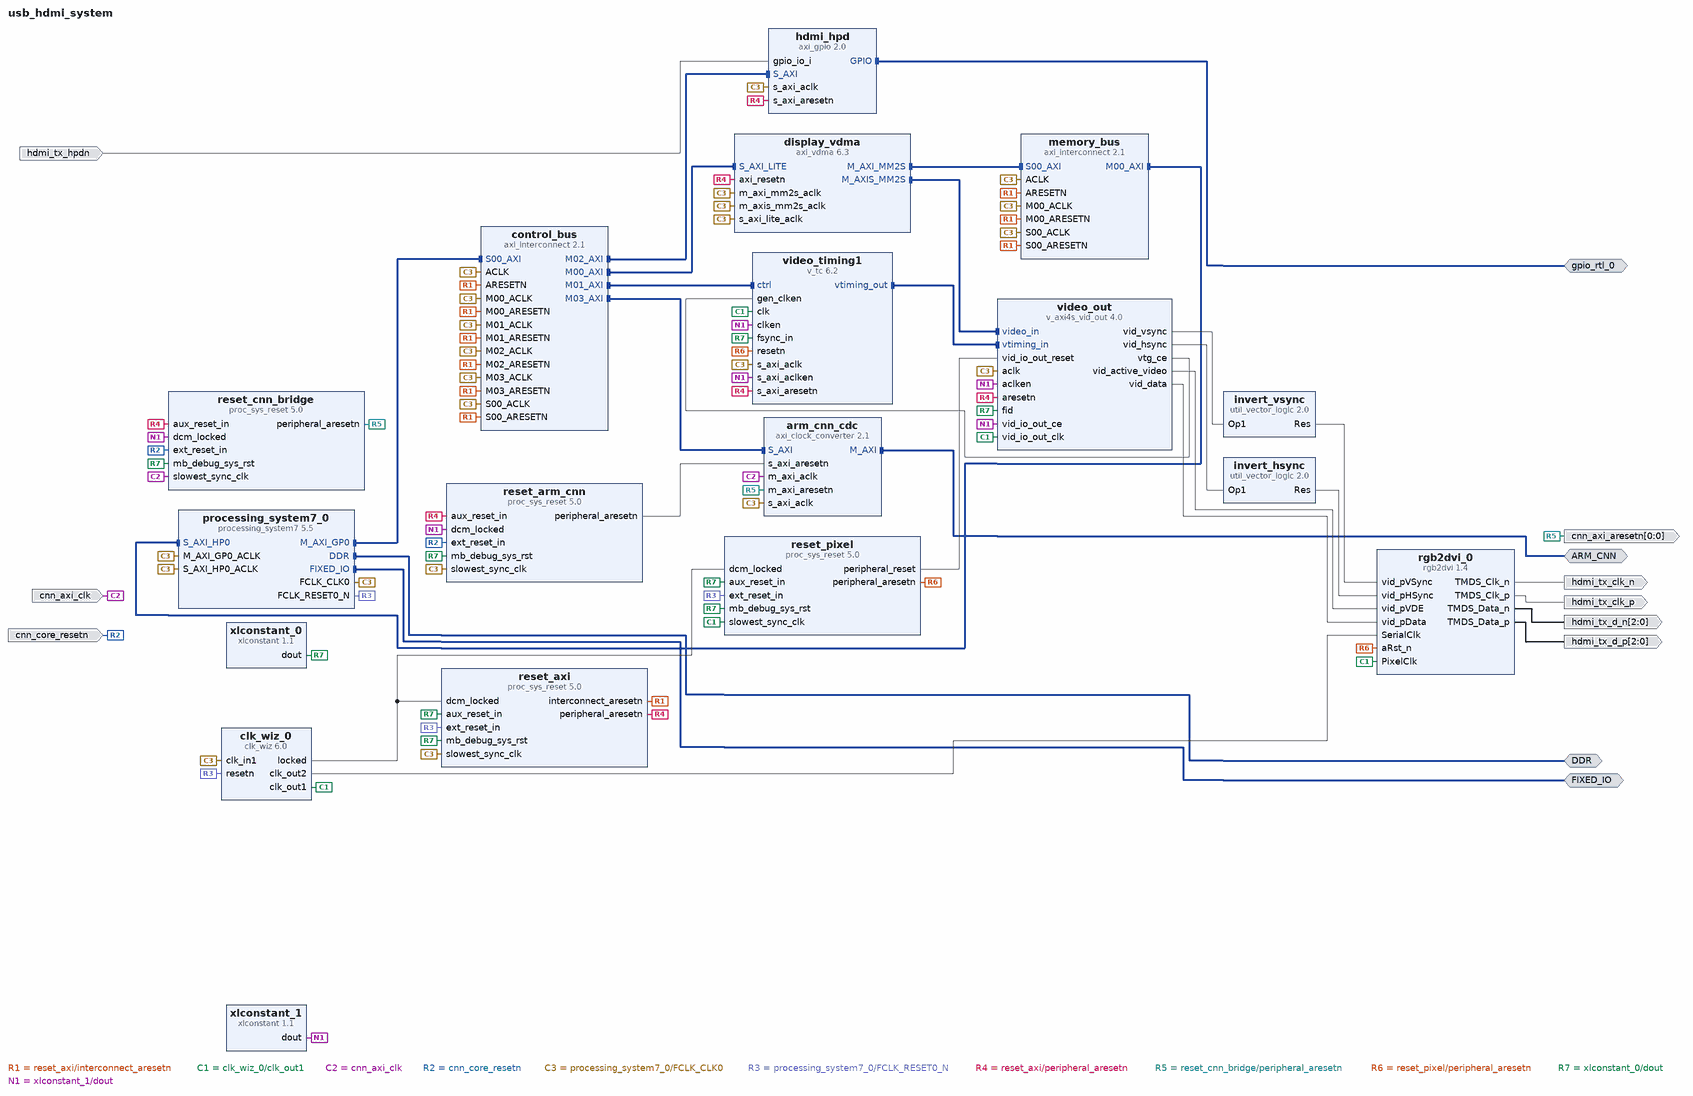
[diagram p0: block diagram of the top level]
# Vivado block design usb_hdmi_system, xc7z020clg400-1, Vivado 2025.2
create_bd_design usb_hdmi_system

create_bd_intf_port -mode Master -vlnv xilinx.com:interface:ddrx_rtl:1.0 DDR
create_bd_intf_port -mode Master -vlnv xilinx.com:display_processing_system7:fixedio_rtl:1.0 FIXED_IO
create_bd_intf_port -mode Master -vlnv xilinx.com:interface:gpio_rtl:1.0 gpio_rtl_0
create_bd_intf_port -mode Master -vlnv xilinx.com:interface:aximm_rtl:1.0 ARM_CNN
set_property -dict [list \
  CONFIG.ADDR_WIDTH 32 \
  CONFIG.DATA_WIDTH 32 \
  CONFIG.FREQ_HZ 125000000 \
  CONFIG.HAS_BRESP 1 \
  CONFIG.HAS_RRESP 1 \
  CONFIG.HAS_WSTRB 1 \
  CONFIG.PROTOCOL AXI4LITE \
] [get_bd_intf_ports ARM_CNN]
create_bd_port -dir O hdmi_tx_clk_p
create_bd_port -dir O hdmi_tx_clk_n
create_bd_port -dir O -from 2 -to 0 hdmi_tx_d_p
create_bd_port -dir O -from 2 -to 0 hdmi_tx_d_n
create_bd_port -dir I hdmi_tx_hpdn
create_bd_port -dir I -type clk cnn_axi_clk
set_property -dict [list \
  CONFIG.ASSOCIATED_BUSIF ARM_CNN \
  CONFIG.ASSOCIATED_RESET cnn_axi_aresetn \
  CONFIG.FREQ_HZ 125000000 \
] [get_bd_ports cnn_axi_clk]
create_bd_port -dir I -type rst cnn_core_resetn
set_property -dict {CONFIG.POLARITY ACTIVE_LOW} [get_bd_ports cnn_core_resetn]
create_bd_port -dir O -from 0 -to 0 -type rst cnn_axi_aresetn
set_property -dict {CONFIG.POLARITY ACTIVE_LOW} [get_bd_ports cnn_axi_aresetn]

create_bd_cell -type ip -vlnv xilinx.com:ip:processing_system7:5.5 processing_system7_0
set_property -dict [list \
  CONFIG.PCW_APU_PERIPHERAL_FREQMHZ 650 \
  CONFIG.PCW_CRYSTAL_PERIPHERAL_FREQMHZ 50 \
  CONFIG.PCW_ENET0_ENET0_IO {MIO 16 .. 27} \
  CONFIG.PCW_ENET0_GRP_MDIO_ENABLE 1 \
  CONFIG.PCW_ENET0_GRP_MDIO_IO {MIO 52 .. 53} \
  CONFIG.PCW_ENET0_PERIPHERAL_ENABLE 1 \
  CONFIG.PCW_ENET_RESET_ENABLE 0 \
  CONFIG.PCW_FPGA0_PERIPHERAL_FREQMHZ 100 \
  CONFIG.PCW_GPIO_MIO_GPIO_ENABLE 1 \
  CONFIG.PCW_GPIO_MIO_GPIO_IO MIO \
  CONFIG.PCW_I2C_RESET_ENABLE 1 \
  CONFIG.PCW_PRESET_BANK1_VOLTAGE {LVCMOS 1.8V} \
  CONFIG.PCW_QSPI_GRP_FBCLK_ENABLE 1 \
  CONFIG.PCW_QSPI_GRP_FBCLK_IO {MIO 8} \
  CONFIG.PCW_QSPI_GRP_SINGLE_SS_ENABLE 1 \
  CONFIG.PCW_QSPI_GRP_SINGLE_SS_IO {MIO 1 .. 6} \
  CONFIG.PCW_QSPI_PERIPHERAL_ENABLE 1 \
  CONFIG.PCW_QSPI_QSPI_IO {MIO 1 .. 6} \
  CONFIG.PCW_SD0_GRP_CD_ENABLE 1 \
  CONFIG.PCW_SD0_GRP_CD_IO {MIO 47} \
  CONFIG.PCW_SD0_GRP_WP_ENABLE 0 \
  CONFIG.PCW_SD0_PERIPHERAL_ENABLE 1 \
  CONFIG.PCW_SD0_SD0_IO {MIO 40 .. 45} \
  CONFIG.PCW_SDIO_PERIPHERAL_FREQMHZ 50 \
  CONFIG.PCW_SINGLE_QSPI_DATA_MODE x4 \
  CONFIG.PCW_UART0_PERIPHERAL_ENABLE 1 \
  CONFIG.PCW_UART0_UART0_IO {MIO 14 .. 15} \
  CONFIG.PCW_UART_PERIPHERAL_FREQMHZ 100 \
  CONFIG.PCW_UIPARAM_DDR_BUS_WIDTH {16 Bit} \
  CONFIG.PCW_UIPARAM_DDR_FREQ_MHZ 525 \
  CONFIG.PCW_UIPARAM_DDR_PARTNO {MT41J256M16 RE-125} \
  CONFIG.PCW_USB0_PERIPHERAL_ENABLE 1 \
  CONFIG.PCW_USB0_RESET_ENABLE 1 \
  CONFIG.PCW_USB0_RESET_IO {MIO 46} \
  CONFIG.PCW_USB0_USB0_IO {MIO 28 .. 39} \
  CONFIG.PCW_USB_RESET_ENABLE 1 \
  CONFIG.PCW_USB_RESET_SELECT {Share reset pin} \
  CONFIG.PCW_USE_S_AXI_HP0 1 \
] [get_bd_cells processing_system7_0]
# 283 more settings of processing_system7_0 are not shown: defaults, MIO pin electricals, DDR timing, and values the tool derives
create_bd_cell -type ip -vlnv digilentinc.com:ip:rgb2dvi:1.4 rgb2dvi_0
set_property -dict {CONFIG.kGenerateSerialClk false CONFIG.kRstActiveHigh false} [get_bd_cells rgb2dvi_0]
create_bd_cell -type ip -vlnv xilinx.com:ip:v_tc:6.2 video_timing1
set_property -dict [list \
  CONFIG.GEN_HSYNC_POLARITY High \
  CONFIG.GEN_VSYNC_POLARITY High \
  CONFIG.HAS_AXI4_LITE true \
  CONFIG.VIDEO_MODE 480p \
  CONFIG.active_chroma_generation false \
  CONFIG.enable_detection false \
  CONFIG.enable_generation true \
] [get_bd_cells video_timing1]
create_bd_cell -type ip -vlnv xilinx.com:ip:axi_vdma:6.3 display_vdma
set_property -dict [list \
  CONFIG.c_addr_width 32 \
  CONFIG.c_include_mm2s 1 \
  CONFIG.c_include_s2mm 0 \
  CONFIG.c_m_axi_mm2s_data_width 64 \
  CONFIG.c_m_axis_mm2s_tdata_width 24 \
  CONFIG.c_mm2s_genlock_mode 0 \
  CONFIG.c_mm2s_linebuffer_depth 1024 \
  CONFIG.c_num_fstores 3 \
  CONFIG.c_use_mm2s_fsync 0 \
] [get_bd_cells display_vdma]
create_bd_cell -type ip -vlnv xilinx.com:ip:v_axi4s_vid_out:4.0 video_out
set_property -dict [list \
  CONFIG.C_HAS_ASYNC_CLK 1 \
  CONFIG.C_NATIVE_COMPONENT_WIDTH 8 \
  CONFIG.C_PIXELS_PER_CLOCK 1 \
  CONFIG.C_S_AXIS_VIDEO_DATA_WIDTH 8 \
  CONFIG.C_S_AXIS_VIDEO_FORMAT 2 \
  CONFIG.C_VTG_MASTER_SLAVE 0 \
] [get_bd_cells video_out]
create_bd_cell -type ip -vlnv xilinx.com:ip:clk_wiz:6.0 clk_wiz_0
set_property -dict [list \
  CONFIG.CLKIN1_JITTER_PS 100 \
  CONFIG.CLKIN1_UI_JITTER 100 \
  CONFIG.CLKIN2_JITTER_PS 100.000 \
  CONFIG.CLKIN2_UI_JITTER 100.000 \
  CONFIG.CLKOUT1_JITTER 470.476 \
  CONFIG.CLKOUT1_PHASE_ERROR 347.350 \
  CONFIG.CLKOUT1_REQUESTED_OUT_FREQ 25.2 \
  CONFIG.CLKOUT1_REQUESTED_PHASE 0 \
  CONFIG.CLKOUT2_JITTER 341.985 \
  CONFIG.CLKOUT2_PHASE_ERROR 347.350 \
  CONFIG.CLKOUT2_REQUESTED_OUT_FREQ 126 \
  CONFIG.CLKOUT2_REQUESTED_PHASE 0 \
  CONFIG.CLKOUT2_USED true \
  CONFIG.JITTER_OPTIONS PS \
  CONFIG.MMCM_CLKFBOUT_MULT_F 31.500 \
  CONFIG.MMCM_CLKIN2_PERIOD 10.000 \
  CONFIG.MMCM_CLKOUT0_DIVIDE_F 25.000 \
  CONFIG.MMCM_CLKOUT1_DIVIDE 5 \
  CONFIG.MMCM_DIVCLK_DIVIDE 5 \
  CONFIG.MMCM_REF_JITTER1 0.010 \
  CONFIG.MMCM_REF_JITTER2 0.010 \
  CONFIG.NUM_OUT_CLKS 2 \
  CONFIG.PRIMITIVE MMCM \
  CONFIG.PRIM_IN_FREQ 100 \
  CONFIG.PRIM_SOURCE No_buffer \
  CONFIG.RESET_PORT resetn \
  CONFIG.RESET_TYPE ACTIVE_LOW \
  CONFIG.SECONDARY_SOURCE Single_ended_clock_capable_pin \
  CONFIG.USE_INCLK_SWITCHOVER false \
  CONFIG.USE_LOCKED true \
  CONFIG.USE_RESET true \
] [get_bd_cells clk_wiz_0]
create_bd_cell -type ip -vlnv xilinx.com:ip:proc_sys_reset:5.0 reset_axi
set_property -dict {CONFIG.C_AUX_RESET_HIGH 1} [get_bd_cells reset_axi]
create_bd_cell -type ip -vlnv xilinx.com:ip:proc_sys_reset:5.0 reset_pixel
set_property -dict {CONFIG.C_AUX_RESET_HIGH 1} [get_bd_cells reset_pixel]
create_bd_cell -type ip -vlnv xilinx.com:ip:axi_gpio:2.0 hdmi_hpd
set_property -dict [list \
  CONFIG.C_ALL_INPUTS 1 \
  CONFIG.C_GPIO_WIDTH 1 \
  CONFIG.C_INTERRUPT_PRESENT 0 \
  CONFIG.C_IS_DUAL 0 \
] [get_bd_cells hdmi_hpd]
create_bd_cell -type ip -vlnv xilinx.com:ip:xlconstant:1.1 xlconstant_0
set_property -dict {CONFIG.CONST_VAL 0 CONFIG.CONST_WIDTH 1} [get_bd_cells xlconstant_0]
create_bd_cell -type ip -vlnv xilinx.com:ip:xlconstant:1.1 xlconstant_1
set_property -dict {CONFIG.CONST_VAL 1 CONFIG.CONST_WIDTH 1} [get_bd_cells xlconstant_1]
create_bd_cell -type ip -vlnv xilinx.com:ip:util_vector_logic:2.0 invert_vsync
set_property -dict {CONFIG.C_OPERATION not CONFIG.C_SIZE 1} [get_bd_cells invert_vsync]
create_bd_cell -type ip -vlnv xilinx.com:ip:util_vector_logic:2.0 invert_hsync
set_property -dict {CONFIG.C_OPERATION not CONFIG.C_SIZE 1} [get_bd_cells invert_hsync]
create_bd_cell -type ip -vlnv xilinx.com:ip:axi_interconnect:2.1 control_bus
set_property -dict {CONFIG.NUM_MI 4 CONFIG.NUM_SI 1} [get_bd_cells control_bus]
create_bd_cell -type ip -vlnv xilinx.com:ip:axi_interconnect:2.1 memory_bus
set_property -dict {CONFIG.NUM_MI 1 CONFIG.NUM_SI 1} [get_bd_cells memory_bus]
create_bd_cell -type ip -vlnv xilinx.com:ip:axi_clock_converter:2.1 arm_cnn_cdc
set_property -dict [list \
  CONFIG.ACLK_ASYNC 1 \
  CONFIG.ADDR_WIDTH 32 \
  CONFIG.DATA_WIDTH 32 \
  CONFIG.PROTOCOL AXI4LITE \
  CONFIG.SYNCHRONIZATION_STAGES 3 \
] [get_bd_cells arm_cnn_cdc]
create_bd_cell -type ip -vlnv xilinx.com:ip:proc_sys_reset:5.0 reset_arm_cnn
set_property -dict {CONFIG.C_AUX_RESET_HIGH 0} [get_bd_cells reset_arm_cnn]
create_bd_cell -type ip -vlnv xilinx.com:ip:proc_sys_reset:5.0 reset_cnn_bridge
set_property -dict {CONFIG.C_AUX_RESET_HIGH 0} [get_bd_cells reset_cnn_bridge]

# ---- connections ----

connect_bd_intf_net [get_bd_intf_pins arm_cnn_cdc/M_AXI] [get_bd_intf_ports ARM_CNN]
connect_bd_intf_net [get_bd_intf_pins control_bus/M00_AXI] [get_bd_intf_pins display_vdma/S_AXI_LITE]
connect_bd_intf_net [get_bd_intf_pins control_bus/M01_AXI] [get_bd_intf_pins video_timing1/ctrl]
connect_bd_intf_net [get_bd_intf_pins control_bus/M02_AXI] [get_bd_intf_pins hdmi_hpd/S_AXI]
connect_bd_intf_net [get_bd_intf_pins control_bus/M03_AXI] [get_bd_intf_pins arm_cnn_cdc/S_AXI]
connect_bd_intf_net [get_bd_intf_pins display_vdma/M_AXIS_MM2S] [get_bd_intf_pins video_out/video_in]
connect_bd_intf_net [get_bd_intf_pins display_vdma/M_AXI_MM2S] [get_bd_intf_pins memory_bus/S00_AXI]
connect_bd_intf_net [get_bd_intf_ports gpio_rtl_0] [get_bd_intf_pins hdmi_hpd/GPIO]
connect_bd_intf_net [get_bd_intf_pins memory_bus/M00_AXI] [get_bd_intf_pins processing_system7_0/S_AXI_HP0]
connect_bd_intf_net [get_bd_intf_ports DDR] [get_bd_intf_pins processing_system7_0/DDR]
connect_bd_intf_net [get_bd_intf_ports FIXED_IO] [get_bd_intf_pins processing_system7_0/FIXED_IO]
connect_bd_intf_net [get_bd_intf_pins processing_system7_0/M_AXI_GP0] [get_bd_intf_pins control_bus/S00_AXI]
connect_bd_intf_net [get_bd_intf_pins video_timing1/vtiming_out] [get_bd_intf_pins video_out/vtiming_in]
connect_bd_net -net ARESETN_1 [get_bd_pins reset_axi/interconnect_aresetn] \
  [get_bd_pins control_bus/ARESETN] [get_bd_pins memory_bus/ARESETN] [get_bd_pins control_bus/M00_ARESETN] \
  [get_bd_pins control_bus/M01_ARESETN] [get_bd_pins control_bus/M02_ARESETN] [get_bd_pins control_bus/S00_ARESETN] \
  [get_bd_pins memory_bus/S00_ARESETN] [get_bd_pins memory_bus/M00_ARESETN] [get_bd_pins control_bus/M03_ARESETN]
connect_bd_net [get_bd_pins clk_wiz_0/clk_out1] \
  [get_bd_pins video_timing1/clk] [get_bd_pins video_out/vid_io_out_clk] [get_bd_pins rgb2dvi_0/PixelClk] \
  [get_bd_pins reset_pixel/slowest_sync_clk]
connect_bd_net [get_bd_pins clk_wiz_0/clk_out2] [get_bd_pins rgb2dvi_0/SerialClk]
connect_bd_net [get_bd_pins clk_wiz_0/locked] [get_bd_pins reset_pixel/dcm_locked] [get_bd_pins reset_axi/dcm_locked]
connect_bd_net [get_bd_ports cnn_axi_clk] [get_bd_pins reset_cnn_bridge/slowest_sync_clk] [get_bd_pins arm_cnn_cdc/m_axi_aclk]
connect_bd_net [get_bd_ports cnn_core_resetn] [get_bd_pins reset_arm_cnn/ext_reset_in] [get_bd_pins reset_cnn_bridge/ext_reset_in]
connect_bd_net [get_bd_ports hdmi_tx_hpdn] [get_bd_pins hdmi_hpd/gpio_io_i]
connect_bd_net [get_bd_pins invert_hsync/Res] [get_bd_pins rgb2dvi_0/vid_pHSync]
connect_bd_net [get_bd_pins invert_vsync/Res] [get_bd_pins rgb2dvi_0/vid_pVSync]
connect_bd_net [get_bd_pins processing_system7_0/FCLK_CLK0] \
  [get_bd_pins clk_wiz_0/clk_in1] [get_bd_pins processing_system7_0/M_AXI_GP0_ACLK] \
  [get_bd_pins processing_system7_0/S_AXI_HP0_ACLK] [get_bd_pins video_out/aclk] [get_bd_pins video_timing1/s_axi_aclk] \
  [get_bd_pins hdmi_hpd/s_axi_aclk] [get_bd_pins reset_axi/slowest_sync_clk] [get_bd_pins control_bus/ACLK] \
  [get_bd_pins control_bus/M00_ACLK] [get_bd_pins display_vdma/s_axi_lite_aclk] [get_bd_pins control_bus/M01_ACLK] \
  [get_bd_pins control_bus/M02_ACLK] [get_bd_pins control_bus/S00_ACLK] [get_bd_pins display_vdma/m_axi_mm2s_aclk] \
  [get_bd_pins memory_bus/S00_ACLK] [get_bd_pins display_vdma/m_axis_mm2s_aclk] [get_bd_pins memory_bus/ACLK] \
  [get_bd_pins memory_bus/M00_ACLK] [get_bd_pins reset_arm_cnn/slowest_sync_clk] [get_bd_pins control_bus/M03_ACLK] \
  [get_bd_pins arm_cnn_cdc/s_axi_aclk]
connect_bd_net [get_bd_pins processing_system7_0/FCLK_RESET0_N] \
  [get_bd_pins clk_wiz_0/resetn] [get_bd_pins reset_axi/ext_reset_in] [get_bd_pins reset_pixel/ext_reset_in]
connect_bd_net [get_bd_pins reset_arm_cnn/peripheral_aresetn] [get_bd_pins arm_cnn_cdc/s_axi_aresetn]
connect_bd_net [get_bd_pins reset_axi/peripheral_aresetn] \
  [get_bd_pins display_vdma/axi_resetn] [get_bd_pins video_out/aresetn] [get_bd_pins video_timing1/s_axi_aresetn] \
  [get_bd_pins hdmi_hpd/s_axi_aresetn] [get_bd_pins reset_arm_cnn/aux_reset_in] [get_bd_pins reset_cnn_bridge/aux_reset_in]
connect_bd_net [get_bd_pins reset_cnn_bridge/peripheral_aresetn] [get_bd_pins arm_cnn_cdc/m_axi_aresetn] [get_bd_ports cnn_axi_aresetn]
connect_bd_net [get_bd_pins reset_pixel/peripheral_aresetn] [get_bd_pins video_timing1/resetn] [get_bd_pins rgb2dvi_0/aRst_n]
connect_bd_net [get_bd_pins reset_pixel/peripheral_reset] [get_bd_pins video_out/vid_io_out_reset]
connect_bd_net [get_bd_pins rgb2dvi_0/TMDS_Clk_n] [get_bd_ports hdmi_tx_clk_n]
connect_bd_net [get_bd_pins rgb2dvi_0/TMDS_Clk_p] [get_bd_ports hdmi_tx_clk_p]
connect_bd_net [get_bd_pins rgb2dvi_0/TMDS_Data_n] [get_bd_ports hdmi_tx_d_n]
connect_bd_net [get_bd_pins rgb2dvi_0/TMDS_Data_p] [get_bd_ports hdmi_tx_d_p]
connect_bd_net [get_bd_pins video_out/vid_active_video] [get_bd_pins rgb2dvi_0/vid_pVDE]
connect_bd_net [get_bd_pins video_out/vid_data] [get_bd_pins rgb2dvi_0/vid_pData]
connect_bd_net [get_bd_pins video_out/vid_hsync] [get_bd_pins invert_hsync/Op1]
connect_bd_net [get_bd_pins video_out/vid_vsync] [get_bd_pins invert_vsync/Op1]
connect_bd_net [get_bd_pins video_out/vtg_ce] [get_bd_pins video_timing1/gen_clken]
connect_bd_net [get_bd_pins xlconstant_0/dout] \
  [get_bd_pins reset_pixel/aux_reset_in] [get_bd_pins reset_axi/aux_reset_in] [get_bd_pins reset_pixel/mb_debug_sys_rst] \
  [get_bd_pins reset_axi/mb_debug_sys_rst] [get_bd_pins video_out/fid] [get_bd_pins video_timing1/fsync_in] \
  [get_bd_pins reset_arm_cnn/mb_debug_sys_rst] [get_bd_pins reset_cnn_bridge/mb_debug_sys_rst]
connect_bd_net [get_bd_pins xlconstant_1/dout] \
  [get_bd_pins video_out/aclken] [get_bd_pins video_out/vid_io_out_ce] [get_bd_pins video_timing1/clken] \
  [get_bd_pins video_timing1/s_axi_aclken] [get_bd_pins reset_arm_cnn/dcm_locked] [get_bd_pins reset_cnn_bridge/dcm_locked]

# ---- address map ----
assign_bd_address -offset 0x00000000 -range 512M -target_address_space [get_bd_addr_spaces display_vdma/Data_MM2S] [get_bd_addr_segs processing_system7_0/S_AXI_HP0/HP0_DDR_LOWOCM]
assign_bd_address -offset 0x40004000 -range 4K -target_address_space [get_bd_addr_spaces processing_system7_0/Data] [get_bd_addr_segs ARM_CNN/Reg]
assign_bd_address -offset 0x41200000 -range 64K -target_address_space [get_bd_addr_spaces processing_system7_0/Data] [get_bd_addr_segs hdmi_hpd/S_AXI/Reg]
assign_bd_address -offset 0x43000000 -range 64K -target_address_space [get_bd_addr_spaces processing_system7_0/Data] [get_bd_addr_segs display_vdma/S_AXI_LITE/Reg]
assign_bd_address -offset 0x43C00000 -range 64K -target_address_space [get_bd_addr_spaces processing_system7_0/Data] [get_bd_addr_segs video_timing1/ctrl/Reg]

validate_bd_design
save_bd_design
